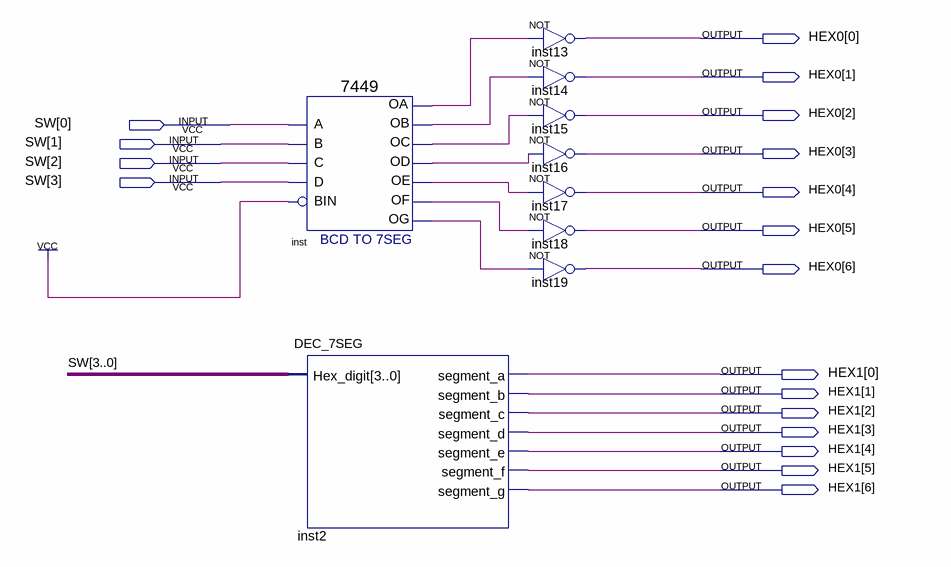
[diagram p0: schematic sheet]
// Quartus schematic Lab_1.bdf as structural Verilog: 9 symbols, 18 pins
module Lab_1 (
  input  [3:0] SW,
  output [6:0] HEX0,
  output [6:0] HEX1
);

  wire inst_oa, inst_ob, inst_oc, inst_od, inst_oe, inst_of, inst_og;

  \7449  inst (
    .A(SW[0]), .C(SW[2]), .B(SW[1]), .D(SW[3]), .BIN(1'b1), .OC(inst_oc), .OD(inst_od), .OF(inst_of),
    .OG(inst_og), .OB(inst_ob), .OA(inst_oa), .OE(inst_oe));
  DEC_7SEG inst2 (
    .Hex_digit(SW), .segment_a(HEX1[0]), .segment_b(HEX1[1]), .segment_c(HEX1[2]), .segment_d(HEX1[3]),
    .segment_e(HEX1[4]), .segment_f(HEX1[5]), .segment_g(HEX1[6]));
  not inst13 (HEX0[0], inst_oa);
  not inst14 (HEX0[1], inst_ob);
  not inst15 (HEX0[2], inst_oc);
  not inst16 (HEX0[3], inst_od);
  not inst17 (HEX0[4], inst_oe);
  not inst18 (HEX0[5], inst_of);
  not inst19 (HEX0[6], inst_og);
endmodule
